# EAGLE design autoshipmaster (EAGLE 5.10)
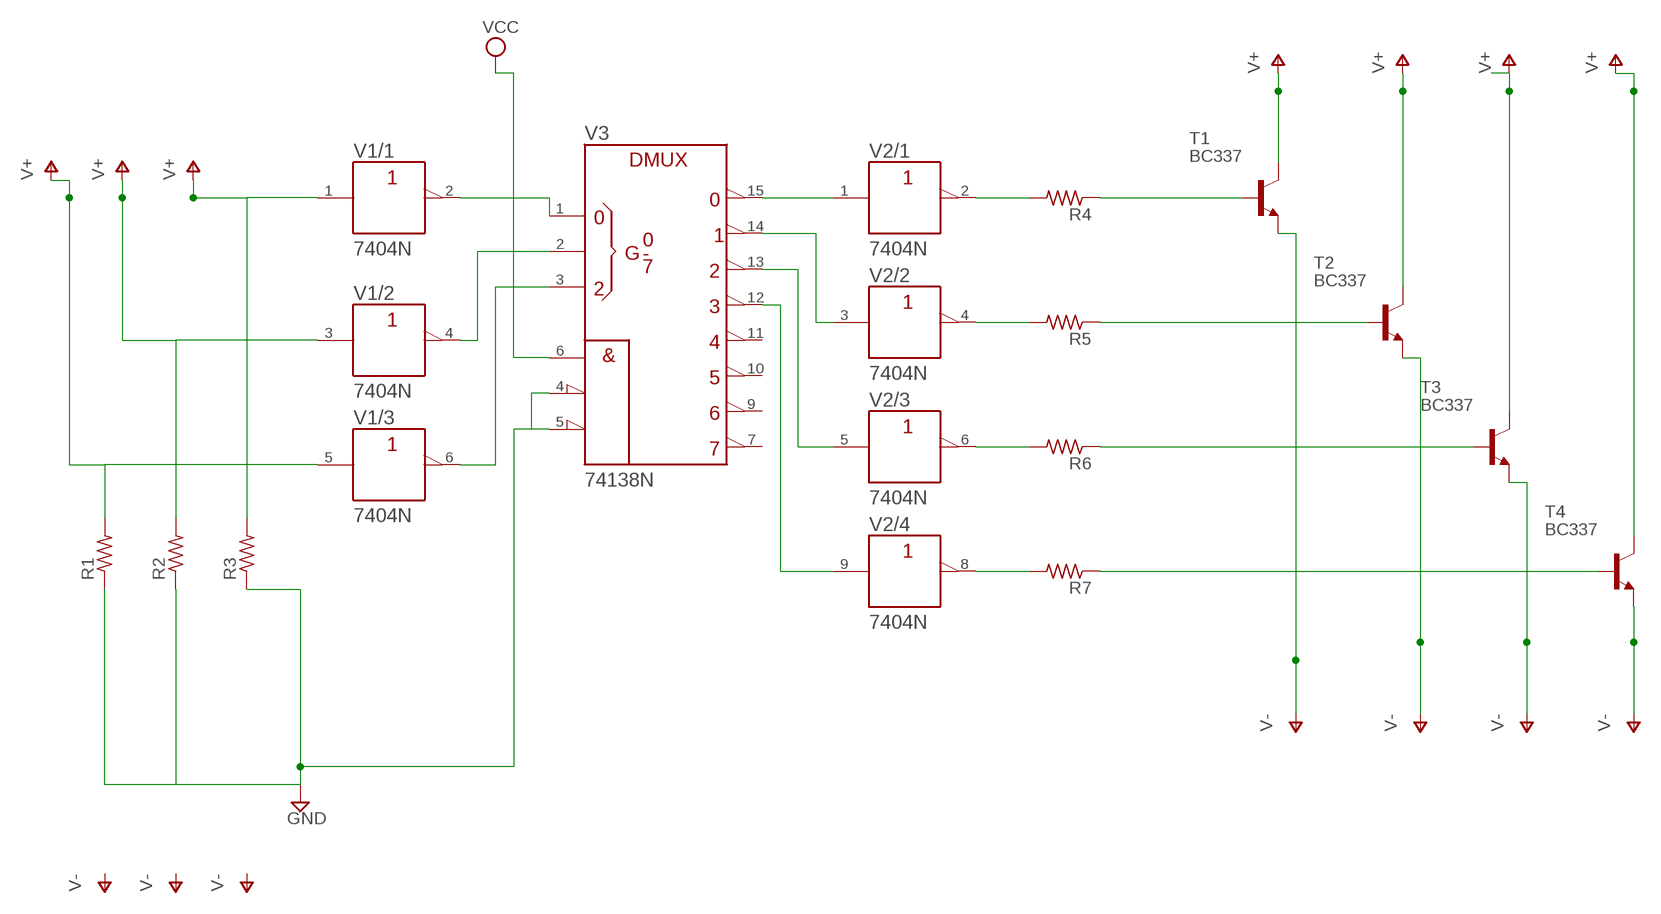
[diagram p0: schematic, sheet 1]

## Parts
R1  R-US_0204/7  [0204/7]
R2  R-US_0204/7  [0204/7]
R3  R-US_0204/7  [0204/7]
R4  R-US_0204/7  [0204/7]
R5  R-US_0204/7  [0204/7]
R6  R-US_0204/7  [0204/7]
R7  R-US_0204/7  [0204/7]
T1  BC337  [TO92]
T2  BC337  [TO92]
T3  BC337  [TO92]
T4  BC337  [TO92]
V1  7404N  [DIL14]
V2  7404N  [DIL14]
V3  74138N  [DIL16]

## Nets
GND: R1.1 R2.1 R3.1 V3.4(!G2A) V3.5(!G2B)
N$4: V1.2(/1:Y) V3.1(A)
N$5: V1.4(/2:Y) V3.2(B)
N$6: V1.6(/3:Y) V3.3(C)
N$9: V2.1(/1:A) V3.15(Y0)
N$10: V2.3(/2:A) V3.14(Y1)
N$11: V2.5(/3:A) V3.13(Y2)
N$12: V2.9(/4:A) V3.12(Y3)
N$13: R4.2 V2.2(/1:Y)
N$14: R5.2 V2.4(/2:Y)
N$15: R6.2 V2.6(/3:Y)
N$16: R7.2 V2.8(/4:Y)
N$17: R4.1 T1.2(B)
N$18: R5.1 T2.2(B)
N$19: R6.1 T3.2(B)
N$20: R7.1 T4.2(B)
V+: R1.2 R2.2 R3.2 T1.3(C) T2.3(C) T3.3(C) T4.3(C) V1.1(/1:A) V1.3(/2:A) V1.5(/3:A)
V-: T1.1(E) T2.1(E) T3.1(E) T4.1(E)
VCC: V3.6(G1)
Unconnected: V1.8(/4:Y) V1.9(/4:A) V1.10(/5:Y) V1.11(/5:A) V1.12(/6:Y) V1.13(/6:A) V2.10(/5:Y) V2.11(/5:A) V2.12(/6:Y) V2.13(/6:A) V3.7(Y7) V3.9(Y6) V3.10(Y5) V3.11(Y4)

## Power pins joined to a net without a drawn wire
+UB: V1.14(/+UB:+UB) V2.14(/+UB:+UB) V3.16(+UB)
-UB: V1.7(/-UB:-UB) V2.7(/-UB:-UB) V3.8(-UB)

## Library data of the parts
R1-R7 = resistor:R-US_: RESISTOR, American symbol
T1-T4 = transistor:BC337: NPN TRANSISTOR
V1 V2 = 74ttl-din:74*04: Hex INVERTER
V3 = 74ttl-din:74*138: 3-line to 8-line DECODER/DEMULTIPLEXER

## Board
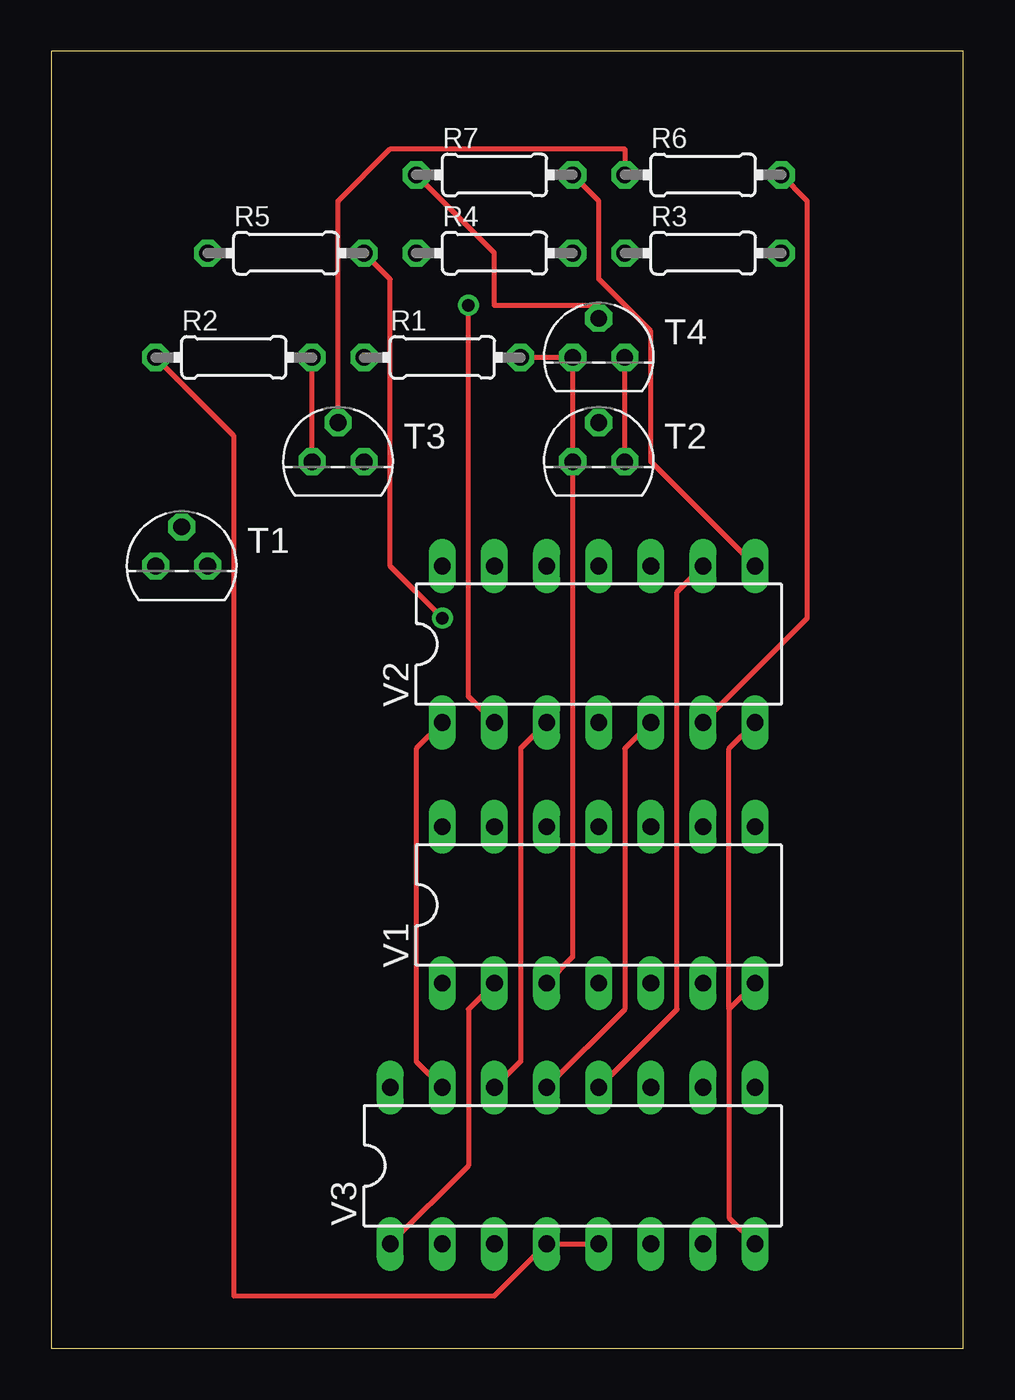
[diagram p1: board, top side]
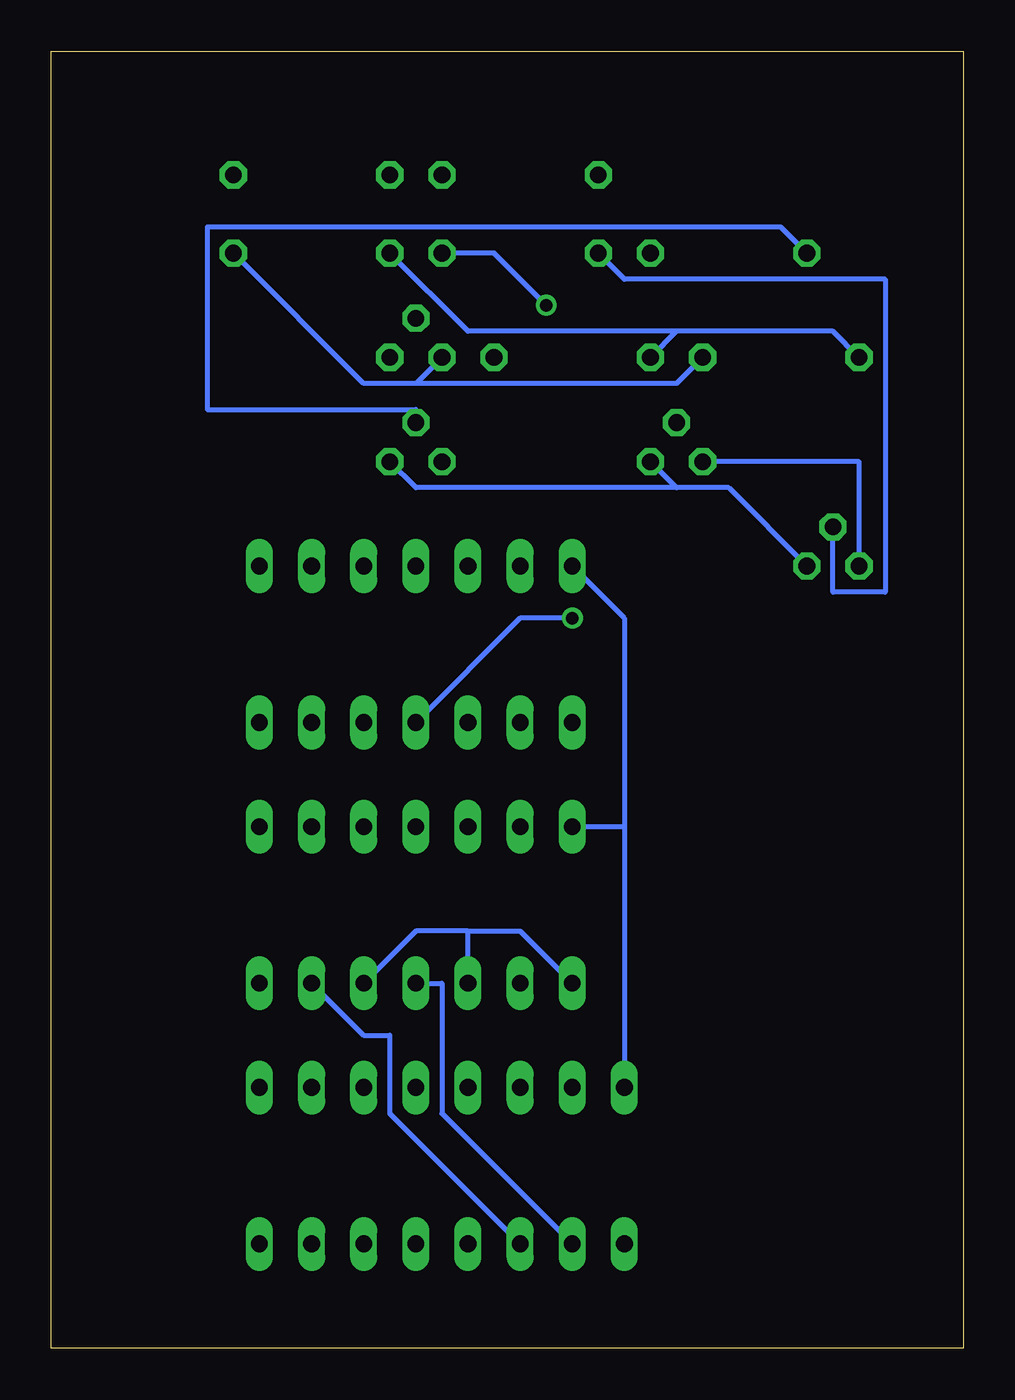
[diagram p2: board, bottom side, seen from below]

Size 44.43 x 63.17 mm. Coordinates in mm from the lower left corner, seen from the top.
Outline: 0,0 44.43,0 44.43,63.17 0,63.17 0,0
Copper layers (1*16): Top 0.035mm / dielectric 1.5mm / Bottom 0.035mm
Design rules "default": minimum track width 10mil, minimum drill 24mil, track to track 8mil, track to pad 8mil, pad to pad 8mil, via to via 8mil, smd to smd 8mil, copper to edge 40mil, drill to drill 8mil, minimum pad ring 10mil, minimum via ring 8mil, stop-mask expansion 4mil, vias tented up to drill 0mil, thermal gap 10mil

### Footprints (pad centres in the part's own frame; a part is rotated, then mirrored left to right if it is on the bottom)
0204/7 = drill 0.813 octagon: 1 -3.81,0; 2 3.81,0
TO92 = drill 0.813 octagon: 1 1.27,0; 2 0,1.905; 3 -1.27,0
DIL14 = drill 0.813 long: 1 -7.62,-3.81; 2 -5.08,-3.81; 3 -2.54,-3.81; 4 0,-3.81; 5 2.54,-3.81; 6 5.08,-3.81; 7 7.62,-3.81; 8 7.62,3.81; 9 5.08,3.81; 10 2.54,3.81; 11 0,3.81; 12 -2.54,3.81; 13 -5.08,3.81; 14 -7.62,3.81
DIL16 = drill 0.813 long: 1 -8.89,-3.81; 2 -6.35,-3.81; 3 -3.81,-3.81; 4 -1.27,-3.81; 5 1.27,-3.81; 6 3.81,-3.81; 7 6.35,-3.81; 8 8.89,-3.81; 9 8.89,3.81; 10 6.35,3.81; 11 3.81,3.81; 12 1.27,3.81; 13 -1.27,3.81; 14 -3.81,3.81; 15 -6.35,3.81; 16 -8.89,3.81

### Placement (x,y rotation side)
R1  19.05,48.26 0 top
R2  8.89,48.26 0 top
R3  31.75,53.34 0 top
R4  21.59,53.34 0 top
R5  11.43,53.34 0 top
R6  31.75,57.15 0 top
R7  21.59,57.15 0 top
T1  6.35,38.1 0 top
T2  26.67,43.18 0 top
T3  13.97,43.18 0 top
T4  26.67,48.26 0 top
V1  26.67,21.59 0 top
V2  26.67,34.29 0 top
V3  25.4,8.89 0 top

### Tracks (layer width: path | path; a pad name or v marks a point on that pad's centre or on a via)
+UB
  Bottom 0.254: 16.51,25.4 V3.16 | 16.51,25.4 V1.14 | V2.14 16.51,35.56 16.51,25.4
-UB
  Top 0.254: V3.8 33.02,6.35 33.02,16.51 | V1.7 33.02,16.51 | V2.7 33.02,29.21 33.02,16.51
GND
  Top 0.254: V3.5 V3.4 21.59,2.54 8.89,2.54 8.89,44.45 R2.1
  Bottom 0.254: R2.1 6.35,49.53 13.97,49.53 | 13.97,49.53 R1.1 | R3.1 24.13,49.53 13.97,49.53
N$4
  Top 0.254: V3.1 20.32,8.89 20.32,16.51 V1.2
N$5
  Bottom 0.254: V3.2 25.4,11.43 25.4,17.78 V1.4
N$6
  Bottom 0.254: V3.3 27.94,11.43 27.94,15.24 29.21,15.24 V1.6
N$9
  Top 0.254: V3.15 17.78,13.97 17.78,29.21 V2.1
N$10
  Top 0.254: V3.14 22.86,13.97 22.86,29.21 V2.3
N$11
  Top 0.254: V3.13 27.94,16.51 27.94,29.21 V2.5
N$12
  Top 0.254: V3.12 30.48,16.51 30.48,36.83 V2.9
N$13  (via drill 0.61)
  Top 0.254: V2.2 20.32,31.75 v20.32,50.8
  Bottom 0.254: v20.32,50.8 22.86,53.34 R4.2
N$14  (via drill 0.61)
  Top 0.254: v19.05,35.56 16.51,38.1 16.51,52.07 R5.2
  Bottom 0.254: V2.4 21.59,35.56 v19.05,35.56
N$15
  Top 0.254: V2.6 36.83,35.56 36.83,55.88 R6.2
N$16
  Top 0.254: V2.8 29.21,43.18 29.21,49.53 26.67,52.07 26.67,55.88 R7.2
N$17
  Bottom 0.254: R4.1 16.51,52.07 3.81,52.07 3.81,36.83 6.35,36.83 T1.2
N$18
  Bottom 0.254: R5.1 8.89,54.61 36.83,54.61 36.83,45.72 26.67,45.72 T2.2
N$19
  Top 0.254: R6.1 27.94,58.42 16.51,58.42 13.97,55.88 T3.2
N$20
  Top 0.254: R7.1 21.59,53.34 21.59,50.8 26.67,50.8 T4.2
V+
  Top 0.254: T3.3 R2.2 | R1.2 T4.3 T2.3 25.4,19.05 V1.3
  Bottom 0.254: T1.3 5.08,43.18 T3.3 | V1.1 21.59,20.32 24.13,20.32 | 24.13,20.32 26.67,20.32 V1.5 | V1.3 24.13,20.32 | R3.2 29.21,46.99 26.67,46.99 | 26.67,46.99 T4.3 | R2.2 13.97,46.99 26.67,46.99
V-
  Top 0.254: T2.1 T4.1
  Bottom 0.254: T1.1 11.43,41.91 13.97,41.91 | 13.97,41.91 T3.1 | T2.1 26.67,41.91 13.97,41.91